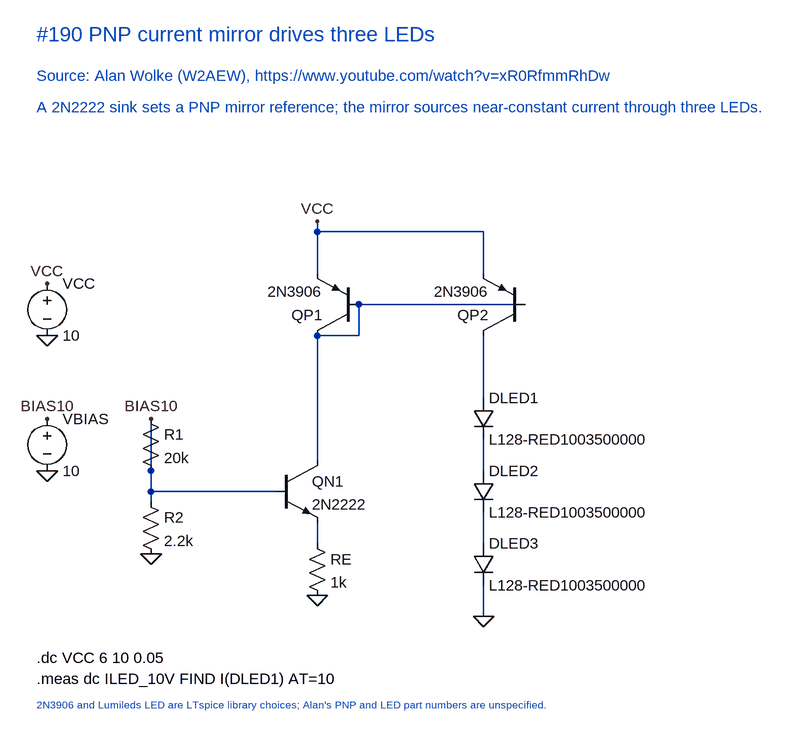
[diagram p0: schematic PNP mirror - three LEDs.asc]
PNP mirror - three LEDs.asc, the LTspice schematic file:
Version 4.1
SHEET 1 1100 1000
WIRE 480 160 480 144
WIRE 736 160 480 160
WIRE 480 224 480 160
WIRE 736 224 736 160
WIRE 480 512 480 320
WIRE 544 320 480 320
WIRE 544 320 544 272
WIRE 800 272 544 272
WIRE 480 640 480 608
WIRE 224 496 224 448
WIRE 224 560 224 496
WIRE 416 560 224 560
WIRE 224 576 224 560
WIRE 736 416 736 320
WIRE 736 528 736 480
WIRE 736 640 736 592
FLAG 480 144 VCC
FLAG 224 448 BIAS10
FLAG 224 656 0
FLAG 480 720 0
WIRE 736 752 736 704
FLAG 736 752 0
FLAG 64 240 VCC
FLAG 64 320 0
FLAG 64 448 BIAS10
FLAG 64 528 0
SYMBOL voltage 64 224 R0
SYMATTR InstName VCC
SYMATTR Value 10
SYMBOL voltage 64 432 R0
SYMATTR InstName VBIAS
SYMATTR Value 10
SYMBOL res 208 432 R0
SYMATTR InstName R1
SYMATTR Value 20k
SYMBOL res 208 560 R0
SYMATTR InstName R2
SYMATTR Value 2.2k
SYMBOL pnp 544 320 R180
SYMATTR InstName QP1
SYMATTR Value 2N3906
SYMBOL pnp 800 320 R180
SYMATTR InstName QP2
SYMATTR Value 2N3906
SYMBOL npn 416 512 R0
SYMATTR InstName QN1
SYMATTR Value 2N2222
SYMBOL res 464 624 R0
SYMATTR InstName RE
SYMATTR Value 1k
SYMBOL diode 720 416 R0
SYMATTR InstName DLED1
SYMATTR Value L128-RED1003500000
SYMBOL diode 720 528 R0
SYMATTR InstName DLED2
SYMATTR Value L128-RED1003500000
SYMBOL diode 720 640 R0
SYMATTR InstName DLED3
SYMATTR Value L128-RED1003500000
TEXT 48 -144 Left 3 ;#190 PNP current mirror drives three LEDs
TEXT 48 -80 Left 2 ;Source: Alan Wolke (W2AEW), https://www.youtube.com/watch?v=xR0RfmmRhDw
TEXT 48 -32 Left 2 ;A 2N2222 sink sets a PNP mirror reference; the mirror sources near-constant current through three LEDs.
TEXT 48 816 Left 2 !.dc VCC 6 10 0.05
TEXT 48 848 Left 2 !.meas dc ILED_10V FIND I(DLED1) AT=10
TEXT 48 888 Left 1 ;2N3906 and Lumileds LED are LTspice library choices; Alan's PNP and LED part numbers are unspecified.

The netlist it stands for:
* PNP mirror - three LEDs.asc
VCC VCC 0 10
VBIAS BIAS10 0 10
R1 BIAS10 BIAS10 20k
R2 BIAS10 0 2.2k
QP1 N001 N001 VCC 0 2N3906
QP2 N003 N001 VCC 0 2N3906
QN1 N001 BIAS10 N002 0 2N2222
RE N002 0 1k
DLED1 N003 N004 L128-RED1003500000
DLED2 N004 N005 L128-RED1003500000
DLED3 N005 0 L128-RED1003500000
.model D D
.lib standard.dio
.model NPN NPN
.model PNP PNP
.lib standard.bjt
* #190 PNP current mirror drives three LEDs
* Source: Alan Wolke (W2AEW), https://www.youtube.com/watch?v=xR0RfmmRhDw
* A 2N2222 sink sets a PNP mirror reference; the mirror sources near-constant current through three LEDs.
.dc VCC 6 10 0.05
.meas dc ILED_10V FIND I(DLED1) AT=10
* 2N3906 and Lumileds LED are LTspice library choices; Alan's PNP and LED part numbers are unspecified.
.backanno
.end